# Altium schematic sheet Audio.SchDoc
size B; SheetNumber: 3; SheetTotal: 3
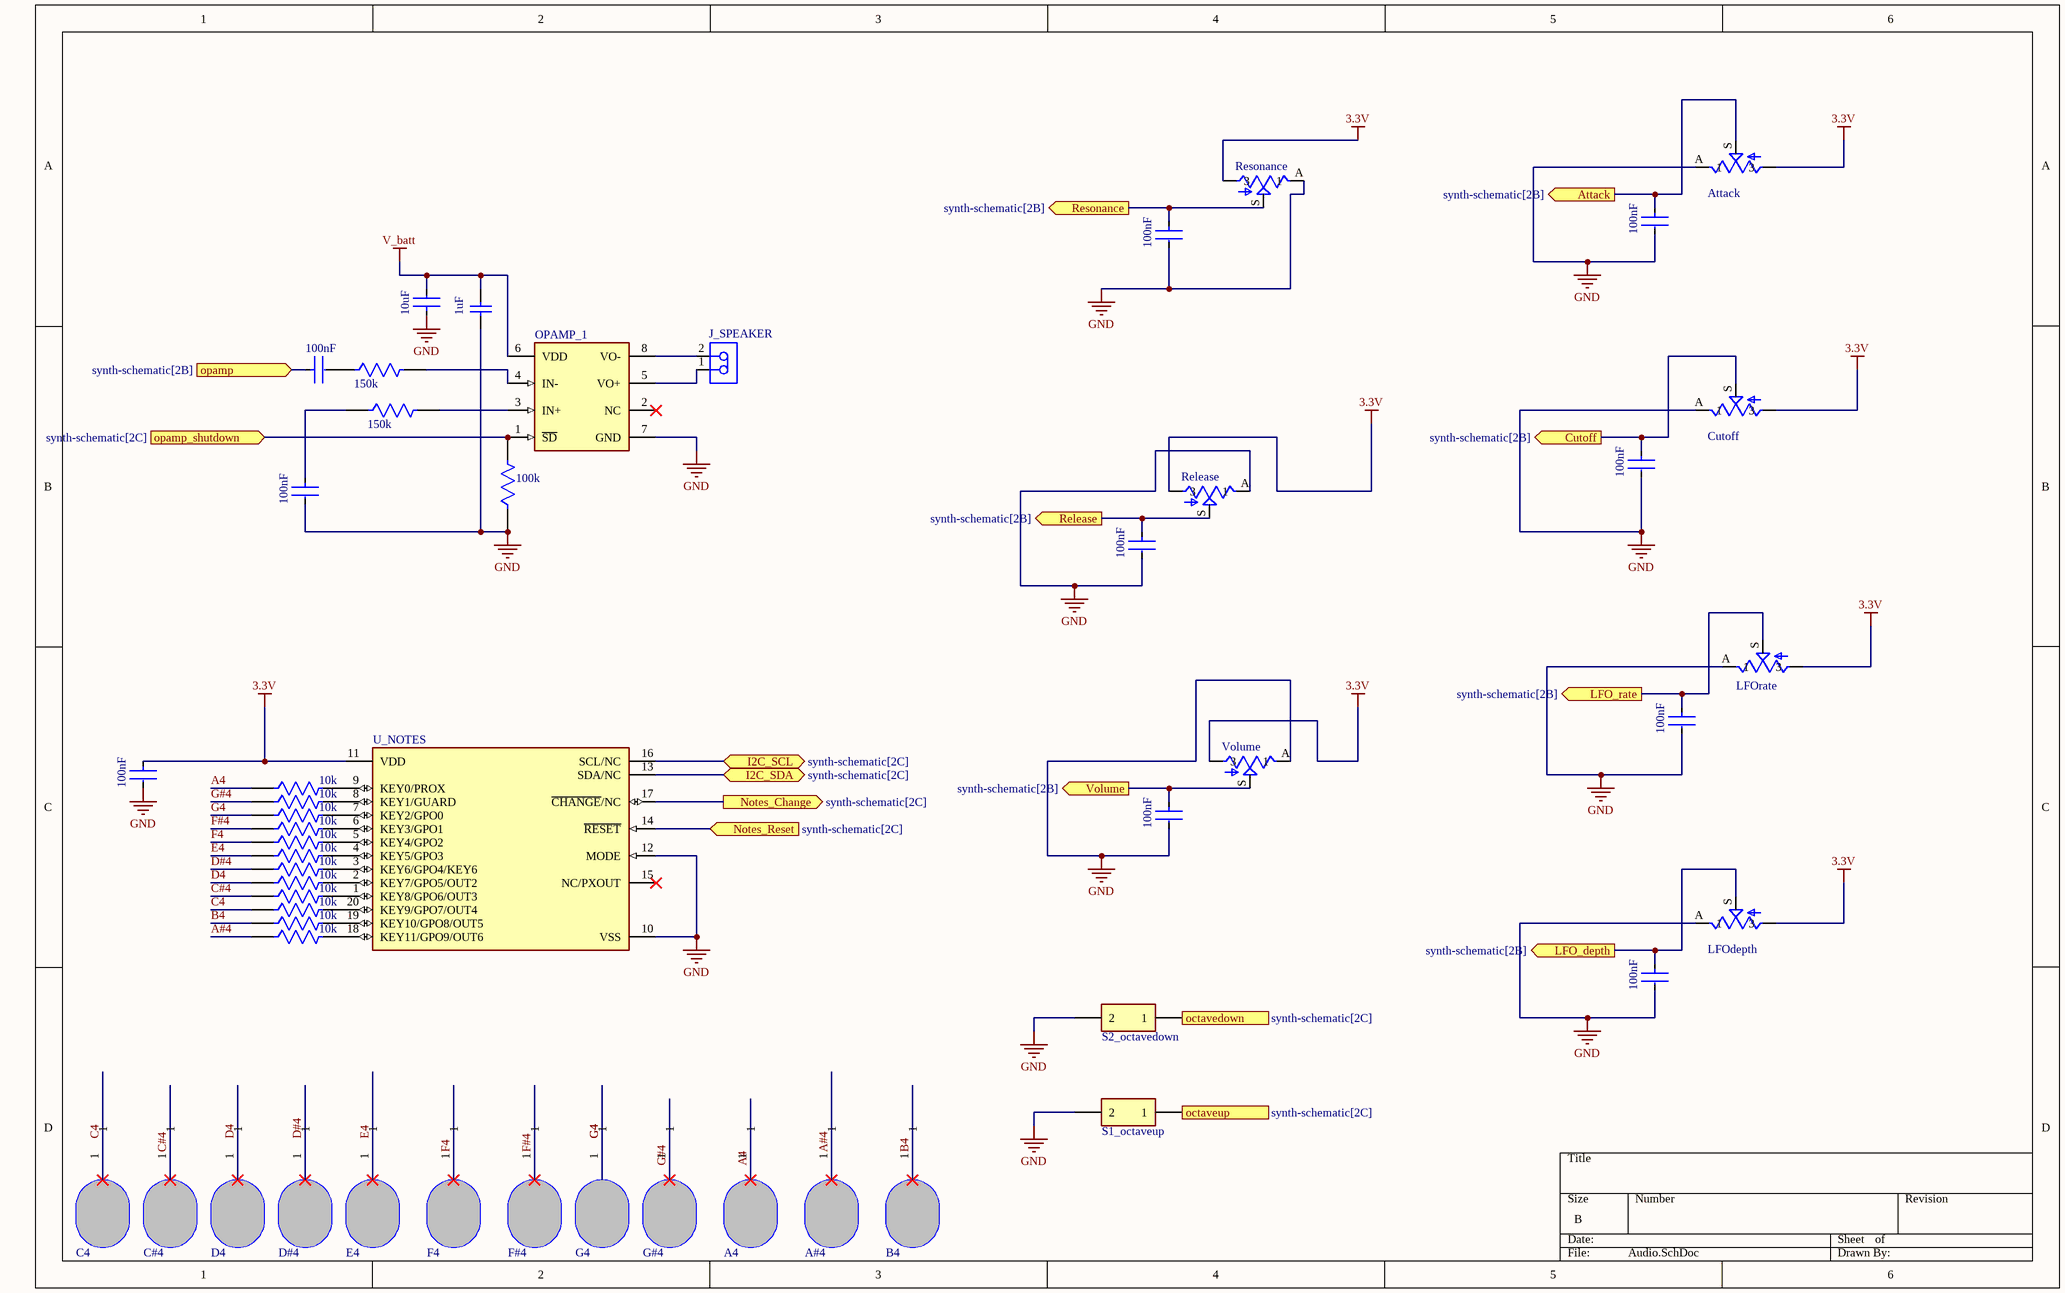
[diagram p0: Audio.SchDoc]

## Parts
A4  touchpad_note  [TOUCH_STAR]  (value not drawn)
A#4  touchpad_note  [TOUCH_STAR]  (value not drawn)
Attack  RK09K1130A6S  [RK09K1130A6S]  (value not drawn)
B4  touchpad_note  [TOUCH_STAR]  (value not drawn)
C4  touchpad_note  [TOUCH_STAR]  (value not drawn)
C#4  touchpad_note  [TOUCH_STAR]  (value not drawn)
C_Attack  100nF  [FP-C0603C-CF-MFG]
C_bulk  10uF  [FP-C0603C106M8PACTU-MFG]
C_Cutoff  100nF  [FP-C0603C-CF-MFG]
C_in  100nF  [FP-C0603C-CF-MFG]
C_LFO_depth  100nF  [FP-C0603C-CF-MFG]
C_LFO_rate  100nF  [FP-C0603C-CF-MFG]
C_opamp1  1uF  [CAPC1608X90X35ML15T15]
C_out  100nF  [FP-C0603C-CF-MFG]
C_Release  100nF  [FP-C0603C-CF-MFG]
C_Resonance  100nF  [FP-C0603C-CF-MFG]
C_u_notes  100nF  [FP-C0603C-CF-MFG]
C_Volume  100nF  [FP-C0603C-CF-MFG]
Cutoff  RK09K1130A6S  [RK09K1130A6S]  (value not drawn)
D4  touchpad_note  [TOUCH_STAR]  (value not drawn)
D#4  touchpad_note  [TOUCH_STAR]  (value not drawn)
E4  touchpad_note  [TOUCH_STAR]  (value not drawn)
F4  touchpad_note  [TOUCH_STAR]  (value not drawn)
F#4  touchpad_note  [TOUCH_STAR]  (value not drawn)
G4  touchpad_note  [TOUCH_STAR]  (value not drawn)
G#4  touchpad_note  [TOUCH_STAR]  (value not drawn)
J_SPEAKER  B2B-PH-K-S(LF)(SN)  [JST-B2B-PH-K-S_V]  (value not drawn)
LFOdepth  RK09K1130A6S  [RK09K1130A6S]  (value not drawn)
LFOrate  RK09K1130A6S  [RK09K1130A6S]  (value not drawn)
OPAMP_1  PAM8302AASCR  [FP-MSOP-8-MFG]  (value not drawn)
R_AMP  100k  [FP-CRGP0603-IPC_C]
R_OPAMP_1  150k  [FP-AT0603-MFG]
R_OPAMP_?  150k  [FP-AT0603-MFG]
Release  RK09K1130A6S  [RK09K1130A6S]  (value not drawn)
Resonance  RK09K1130A6S  [RK09K1130A6S]  (value not drawn)
RU_1  10k  [FP-AC0603-IPC_A]
RU_2  10k  [FP-AC0603-IPC_A]
RU_3  10k  [FP-AC0603-IPC_A]
RU_4  10k  [FP-AC0603-IPC_A]
RU_5  10k  [FP-AC0603-IPC_A]
RU_6  10k  [FP-AC0603-IPC_A]
RU_7  10k  [FP-AC0603-IPC_A]
RU_8  10k  [FP-AC0603-IPC_A]
RU_9  10k  [FP-AC0603-IPC_A]
RU_10  10k  [FP-AC0603-IPC_A]
RU_11  10k  [FP-AC0603-IPC_A]
RU_12  10k  [FP-AC0603-IPC_A]
S1_octaveup  PG151101S11  [SW_PG151101S11]  (value not drawn)
S2_octavedown  PG151101S11  [SW_PG151101S11]  (value not drawn)
U_NOTES  AT42QT2120-XUR  [FP-20X-MFG]  (value not drawn)
Volume  RK09K1130A6S  [RK09K1130A6S]  (value not drawn)

## Ports
Attack (out, see synth-schematic[2B]), Cutoff (out, see synth-schematic[2B]), I2C_SCL (bidir, see synth-schematic[2C]), I2C_SDA (bidir, see synth-schematic[2C]), LFO_depth (out, see synth-schematic[2B]), LFO_rate (out, see synth-schematic[2B]), Notes_Change (out, see synth-schematic[2C]), Notes_Reset (in, see synth-schematic[2C]), octavedown (out, see synth-schematic[2C]), octaveup (out, see synth-schematic[2C]), opamp (in, see synth-schematic[2B]), opamp_shutdown (in, see synth-schematic[2C]), Release (out, see synth-schematic[2B]), Resonance (out, see synth-schematic[2B]), Volume (out, see synth-schematic[2B])

## Nets
3.3V: Attack.E(3) C_u_notes.1 Cutoff.E(3) LFOdepth.E(3) LFOrate.E(3) Release.E(3) Resonance.E(3) U_NOTES.11(VDD) Volume.E(3)
GND: Attack.A(1) C_Attack.2 C_bulk.1 C_Cutoff.2 C_LFO_depth.2 C_LFO_rate.2 C_opamp1.1 C_out.2 C_Release.2 C_Resonance.2 C_u_notes.2 C_Volume.2 Cutoff.A(1) LFOdepth.A(1) LFOrate.A(1) OPAMP_1.7(GND) R_AMP.1 Release.A(1) Resonance.A(1) S1_octaveup.2 S2_octavedown.2 U_NOTES.10(VSS) U_NOTES.12(MODE) Volume.A(1)
V_batt: C_bulk.2 C_opamp1.2 OPAMP_1.6(VDD)
A4: A4.1 RU_1.1
A#4: A#4.1 RU_12.1
Attack: Attack.S C_Attack.1 ; port Attack
B4: B4.1 RU_11.1
C4: C4.1 RU_10.1
C#4: C#4.1 RU_9.1
Cutoff: C_Cutoff.1 Cutoff.S ; port Cutoff
D4: D4.1 RU_8.1
D#4: D#4.1 RU_7.1
E4: E4.1 RU_6.1
F4: F4.1 RU_5.1
F#4: F#4.1 RU_4.1
G4: G4.1 RU_3.1
G#4: G#4.1 RU_2.1
I2C_SCL: U_NOTES.16(SCL/NC) ; port I2C_SCL
I2C_SDA: U_NOTES.13(SDA/NC) ; port I2C_SDA
LFO_depth: C_LFO_depth.1 LFOdepth.S ; port LFO_depth
LFO_rate: C_LFO_rate.1 LFOrate.S ; port LFO_rate
Notes_Change: U_NOTES.17(~{CHANGE}/NC) ; port Notes_Change
Notes_Reset: U_NOTES.14(~{RESET}) ; port Notes_Reset
octavedown: S2_octavedown.1 ; port octavedown
octaveup: S1_octaveup.1 ; port octaveup
opamp: C_in.1 ; port opamp
opamp_shutdown: OPAMP_1.1(~{SD}) R_AMP.2 ; port opamp_shutdown
Release: C_Release.1 Release.S ; port Release
Resonance: C_Resonance.1 Resonance.S ; port Resonance
Volume: C_Volume.1 Volume.S ; port Volume
NetC_in_2: C_in.2 R_OPAMP_1.1
NetC_out_1: C_out.1 R_OPAMP_?.1
NetJ_SPEAKER_1: J_SPEAKER.1 OPAMP_1.5(VO+)
NetJ_SPEAKER_2: J_SPEAKER.2 OPAMP_1.8(VO-)
NetOPAMP_1_3: OPAMP_1.3(IN+) R_OPAMP_?.2
NetOPAMP_1_4: OPAMP_1.4(IN-) R_OPAMP_1.2
NetRU_1_2: RU_1.2 U_NOTES.9(KEY0/PROX)
NetRU_2_2: RU_2.2 U_NOTES.8(KEY1/GUARD)
NetRU_3_2: RU_3.2 U_NOTES.7(KEY2/GPO0)
NetRU_4_2: RU_4.2 U_NOTES.6(KEY3/GPO1)
NetRU_5_2: RU_5.2 U_NOTES.5(KEY4/GPO2)
NetRU_6_2: RU_6.2 U_NOTES.4(KEY5/GPO3)
NetRU_7_2: RU_7.2 U_NOTES.3(KEY6/GPO4/KEY6)
NetRU_8_2: RU_8.2 U_NOTES.2(KEY7/GPO5/OUT2)
NetRU_9_2: RU_9.2 U_NOTES.1(KEY8/GPO6/OUT3)
NetRU_10_2: RU_10.2 U_NOTES.20(KEY9/GPO7/OUT4)
NetRU_11_2: RU_11.2 U_NOTES.19(KEY10/GPO8/OUT5)
NetRU_12_2: RU_12.2 U_NOTES.18(KEY11/GPO9/OUT6)

Not connected (* = marked no-connect by the designer): OPAMP_1 2(NC)*; U_NOTES 15(NC/PXOUT)*

## Library data of the parts
Attack Cutoff LFOdepth LFOrate Release Resonance Volume = RK09K1130A6S: 10k Ohm 1 Gang Linear Through Hole, Snap In Potentiometer None 1.0 Kierros 0.05W, 1/20W PC Pins; MF: ALPS; SnapEDA_Link: https://www.snapeda.com/parts/RK09K1130A6S/ALPS/view-part/?ref=snap; Package: None; Value: *; MP: RK09K1130A6S; Check_prices: https://www.snapeda.com/parts/RK09K1130A6S/ALPS/view-part/?ref=eda
C_Attack C_Cutoff C_in C_LFO_depth C_LFO_rate C_out C_Release C_Resonance C_u_notes C_Volume = CMP-03020-027569-2: C0603 0.10 μF Y5V 30ppm/°C 20.00% 25 V; Manufacturer: KEMET; Manufacturer Part Number: C0603C104M3VAC7411; Value: 0.10 μF; Voltage Rating: 25 V; Automotive Grade: Grade 1; Tolerance: 0.2; ComponentLink2URL: https://api.kemet.com/component-edge/download/datasheet/C0603C100J5GACAUTO.pdf; Package: C0603C-CF; Lead Free: Yes; Device Class L1: Passive Components; Temperature Range High: +125°C; Material: Ceramic; ComponentLink2Description: Datasheet; Automotive: Yes; Temperature: -55°C to +125°C; Temperature Characteristic: Y5V; Capacitance: 0.10 μF; Octopart: https://octopart.com/c0603c104m3vac7411-kemet-2224281; Height: 0.87mm; RoHS: TRUE; Temperature Range Low: -55°C; Device Class L3: Ceramic Capacitors; Temperature Coefficient: 30ppm/°C; Category: Cap; Device Class L2: Capacitors
C_bulk = CMP-03020-034654-1: CAP CER 10UF 10V X5R 0603; RoHS Compliant: Yes
C_opamp1 = CMP-1035-02733-2: Manufacturer: Kemet; Part Number: C0603C105K8RACTU
J_SPEAKER = CMP-2000-05162-1: Male Header, Pitch 2 mm, 1 x 2 Position, Height 6 mm, Tail Length 3.4 mm, -25 to 85 degC, RoHS, Bulk; Manufacturer: JST; Pitch: 2mm; Style/Orientation: StraightHeader/Plug; No of Positions: 2; Datasheet Version: Nov-08; Datasheet URL: http://datasheet.octopart.com/B2B-PH-K-S%28LF%29%28SN%29-JST-datasheet-8324864.pdf; Manufacturer URL: http://www.jst.com/home2.html; Type: ShroudedHeader; Termination: Crimp
OPAMP_1 = CMP-12733-000002-1: IC AMP CLASS D MONO 2.5W 8MSOP; Manufacturer: Diodes Inc.; Nominal Supply Current: 4mA; Number Of Channels: 1; Max Junction Temp: +125°C; Min Supply Voltage: 2V; Power At Speaker R: 2.5W @ 4Ω; Max Supply Voltage: 5.5V; Voltage Gain: 24dB; Standoff Height: 0.05mm; Manufacturer Part Number: PAM8302AASCR; ComponentLink2URL: https://www.diodes.com/assets/Datasheets/PAM8302A.pdf; Mouser Description: Audio Amplifiers 2.5W MONO FILTERLESS CLASS-D AUDIO AMP; ComponentLink2Description: Datasheet; Temperature: -40°C to +85°C; Automotive: No; Footprint Url: https://www.diodes.com/assets/Package-Files/MSOP-8.pdf; Device Class L1: Integrated Circuits (ICs); Temperature Range Low: -40°C; Temperature Range High: +85°C; Lead Free: Yes; Package: MSOP-8; Height: 1.1mm; Category: IC; Ipc Land Pattern Name: SOP65P490X110-8; Octopart: https://octopart.com/pam8302aascr-diodes+inc.-29030473; RoHS: TRUE; Device Class L3: Amplifiers - Audio; Device Class L2: Linear ICs; Digikey Description: IC AMP CLASS D MONO 2.5W 8MSOP
R_AMP = CMP-03211-000885-1: CRGP 0603 100K 1%; Manufacturer: TE; Manufacturer Part Number: CRGP0603F100K; Power Rating: 0.25W; Resistance: 100KΩ; Voltage Rating: 50V; Value: 100KΩ; Tolerance: 0.01; Temperature Coefficient: ±100ppm/°C; Device Class L2: Resistors; Temperature: -55°C to +155°C; Temperature Range High: +155°C; Ambient Temperature Range High: +70°C; Lead Free: Yes; RoHS: TRUE; Octopart: https://octopart.com/crgp0603f100k-te+connectivity-91018719; Digikey Description: CRGP 0603 100K 1%; Automotive: No; ComponentLink2Description: Datasheet; Category: Res; Ipc Land Pattern Name: RESC16080X45; Device Class L3: Chip SMD Resistors; Composition: Thick Film; Temperature Range Low: -55°C; Height: 0.55mm; Device Class L1: Passive Components; Series: CRGP; Package: CRGP0603; ComponentLink2URL: https://www.te.com/commerce/DocumentDelivery/DDEController?Action=srchrtrv&DocNm=9-1773463-9&DocType=DS&DocLang=English
R_OPAMP_1 R_OPAMP_? = CMP-03412-030814-2: Thin Film Chip Resistors Automotive Grade 150kΩ 0.1% 50ppm/°C 0603; Resistance: 150kR; Max Power Dissipation: 100mW; Length: 0.063inch; Temperature Coefficient: 50ppm/°C; Packaging: Tape and Reel; Tolerance: 0.1%; Width: 0.032inch; Case/Package: 0603; Min Operating Temperature: -55°C; Features: Moisture Resistant; Max Operating Temperature: 155°C; Resistor Type: Thin Film; Series: AT; Height: 0.022inch; RoHS Compliant: Yes; Number of Terminations: 2
RU_1-RU_12 = CMP-03412-040683-1: RES 10kΩ 5.00% 0.2W 0603
S1_octaveup S2_octavedown = PG151101S11: MF: Kailh; SnapEDA_Link: https://www.snapeda.com/parts/PG151101S11/Kailh/view-part/?ref=snap; Package: Package; Value: *; MP: PG151101S11; Check_prices: https://www.snapeda.com/parts/PG151101S11/Kailh/view-part/?ref=eda
U_NOTES = CMP-06270-000024-1: IC TOUCH SENSOR 12CH 20TSSOP; Interface: I2C; Number of Channels: 12; Series: QTouch™; Max Operating Temperature: 85°C; Case/Package: TSSOP; RoHS Compliant: Yes; Number of Pins: 20; Min Operating Temperature: -40°C; Package Quantity: 4000; Packaging: Tape and Reel